# Altium schematic sheet 000_Hieralchical.SchDoc: HIERALCHICAL system
size A4; Date: XXXXXX; DrawnBy: C.A.Cuaspa; Revision: R1V0; SheetNumber: 1; SheetTotal: 3
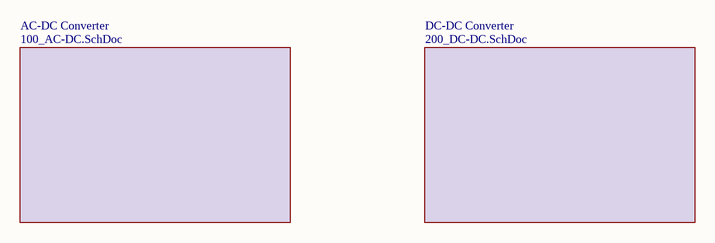
[diagram p0: 000_Hieralchical.SchDoc]

## Sub-sheets
AC-DC Converter = 100_AC-DC.SchDoc: no entries
DC-DC Converter = 200_DC-DC.SchDoc: no entries

## Notes on the sheet
- Title:
- Project:
- File:
- Revision:
- Date:
- Size:
- A4
- Drawn by: